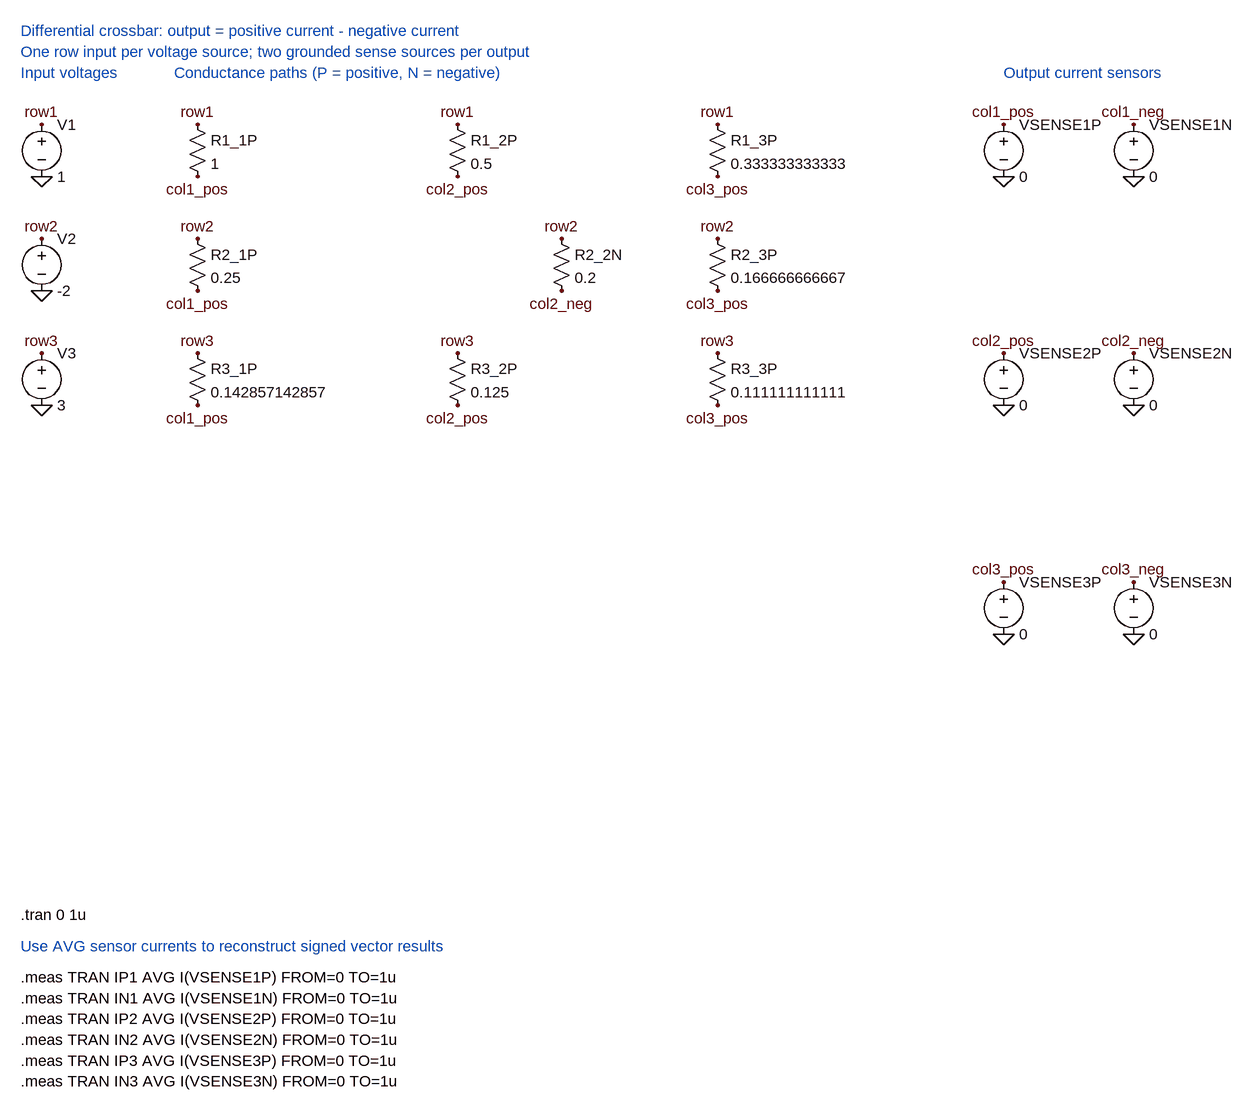
[diagram p0: schematic crossbar_8x64.asc]
crossbar_8x64.asc, the LTspice schematic file:
Version 4
SHEET 1 1840 1752
TEXT 64 16 Left 2 ;Differential crossbar: output = positive current - negative current
TEXT 64 48 Left 2 ;One row input per voltage source; two grounded sense sources per output
TEXT 64 80 Left 2 ;Input voltages
TEXT 300 80 Left 2 ;Conductance paths (P = positive, N = negative)
SYMBOL voltage 96 144 R0
SYMATTR InstName V1
SYMATTR Value 1
FLAG 96 160 row1
FLAG 96 240 0
SYMBOL voltage 96 320 R0
SYMATTR InstName V2
SYMATTR Value -2
FLAG 96 336 row2
FLAG 96 416 0
SYMBOL voltage 96 496 R0
SYMATTR InstName V3
SYMATTR Value 3
FLAG 96 512 row3
FLAG 96 592 0
SYMBOL res 320 144 R0
SYMATTR InstName R1_1P
SYMATTR Value 1
FLAG 336 160 row1
FLAG 336 240 col1_pos
SYMBOL res 720 144 R0
SYMATTR InstName R1_2P
SYMATTR Value 0.5
FLAG 736 160 row1
FLAG 736 240 col2_pos
SYMBOL res 1120 144 R0
SYMATTR InstName R1_3P
SYMATTR Value 0.333333333333
FLAG 1136 160 row1
FLAG 1136 240 col3_pos
SYMBOL res 320 320 R0
SYMATTR InstName R2_1P
SYMATTR Value 0.25
FLAG 336 336 row2
FLAG 336 416 col1_pos
SYMBOL res 880 320 R0
SYMATTR InstName R2_2N
SYMATTR Value 0.2
FLAG 896 336 row2
FLAG 896 416 col2_neg
SYMBOL res 1120 320 R0
SYMATTR InstName R2_3P
SYMATTR Value 0.166666666667
FLAG 1136 336 row2
FLAG 1136 416 col3_pos
SYMBOL res 320 496 R0
SYMATTR InstName R3_1P
SYMATTR Value 0.142857142857
FLAG 336 512 row3
FLAG 336 592 col1_pos
SYMBOL res 720 496 R0
SYMATTR InstName R3_2P
SYMATTR Value 0.125
FLAG 736 512 row3
FLAG 736 592 col2_pos
SYMBOL res 1120 496 R0
SYMATTR InstName R3_3P
SYMATTR Value 0.111111111111
FLAG 1136 512 row3
FLAG 1136 592 col3_pos
TEXT 1576 80 Left 2 ;Output current sensors
SYMBOL voltage 1576 144 R0
SYMATTR InstName VSENSE1P
SYMATTR Value 0
FLAG 1576 160 col1_pos
FLAG 1576 240 0
SYMBOL voltage 1776 144 R0
SYMATTR InstName VSENSE1N
SYMATTR Value 0
FLAG 1776 160 col1_neg
FLAG 1776 240 0
SYMBOL voltage 1576 496 R0
SYMATTR InstName VSENSE2P
SYMATTR Value 0
FLAG 1576 512 col2_pos
FLAG 1576 592 0
SYMBOL voltage 1776 496 R0
SYMATTR InstName VSENSE2N
SYMATTR Value 0
FLAG 1776 512 col2_neg
FLAG 1776 592 0
SYMBOL voltage 1576 848 R0
SYMATTR InstName VSENSE3P
SYMATTR Value 0
FLAG 1576 864 col3_pos
FLAG 1576 944 0
SYMBOL voltage 1776 848 R0
SYMATTR InstName VSENSE3N
SYMATTR Value 0
FLAG 1776 864 col3_neg
FLAG 1776 944 0
TEXT 64 1376 Left 2 !.tran 0 1u
TEXT 64 1424 Left 2 ;Use AVG sensor currents to reconstruct signed vector results
TEXT 64 1472 Left 2 !.meas TRAN IP1 AVG I(VSENSE1P) FROM=0 TO=1u
TEXT 64 1504 Left 2 !.meas TRAN IN1 AVG I(VSENSE1N) FROM=0 TO=1u
TEXT 64 1536 Left 2 !.meas TRAN IP2 AVG I(VSENSE2P) FROM=0 TO=1u
TEXT 64 1568 Left 2 !.meas TRAN IN2 AVG I(VSENSE2N) FROM=0 TO=1u
TEXT 64 1600 Left 2 !.meas TRAN IP3 AVG I(VSENSE3P) FROM=0 TO=1u
TEXT 64 1632 Left 2 !.meas TRAN IN3 AVG I(VSENSE3N) FROM=0 TO=1u

The netlist it stands for:
* crossbar_8x64.asc
V1 row1 0 1
V2 row2 0 -2
V3 row3 0 3
R1_1P row1 col1_pos 1
R1_2P row1 col2_pos 0.5
R1_3P row1 col3_pos 0.333333333333
R2_1P row2 col1_pos 0.25
R2_2N row2 col2_neg 0.2
R2_3P row2 col3_pos 0.166666666667
R3_1P row3 col1_pos 0.142857142857
R3_2P row3 col2_pos 0.125
R3_3P row3 col3_pos 0.111111111111
VSENSE1P col1_pos 0 0
VSENSE1N col1_neg 0 0
VSENSE2P col2_pos 0 0
VSENSE2N col2_neg 0 0
VSENSE3P col3_pos 0 0
VSENSE3N col3_neg 0 0
* Differential crossbar: output = positive current - negative current
* One row input per voltage source; two grounded sense sources per output
* Input voltages
* Conductance paths (P = positive, N = negative)
* Output current sensors
.tran 0 1u
* Use AVG sensor currents to reconstruct signed vector results
.meas TRAN IP1 AVG I(VSENSE1P) FROM=0 TO=1u
.meas TRAN IN1 AVG I(VSENSE1N) FROM=0 TO=1u
.meas TRAN IP2 AVG I(VSENSE2P) FROM=0 TO=1u
.meas TRAN IN2 AVG I(VSENSE2N) FROM=0 TO=1u
.meas TRAN IP3 AVG I(VSENSE3P) FROM=0 TO=1u
.meas TRAN IN3 AVG I(VSENSE3N) FROM=0 TO=1u
.backanno
.end

* Results of the author's LTspice run, read from the files saved beside the schematic
* From the log:
*   ip1: AVG(I(VSENSE1P))=14 FROM 0 TO 1e-06
*   in1: AVG(I(VSENSE1N))=0 FROM 0 TO 1e-06
*   ip2: AVG(I(VSENSE2P))=26 FROM 0 TO 1e-06
*   in2: AVG(I(VSENSE2N))=-10 FROM 0 TO 1e-06
*   ip3: AVG(I(VSENSE3P))=18 FROM 0 TO 1e-06
*   in3: AVG(I(VSENSE3N))=0 FROM 0 TO 1e-06